# Altium schematic sheet buck__Buck.SchDoc: 12 V to 5 V 3 A Synchronous Buck
size A3; Date: 2026-10-13; Author: Anon Author; DrawnBy: Anon Author; DocumentNumber: buck-12v-5v-3a / Buck; Revision: A; SheetNumber: 1; SheetTotal: 1; ProjectName: buck-12v-5v-3a
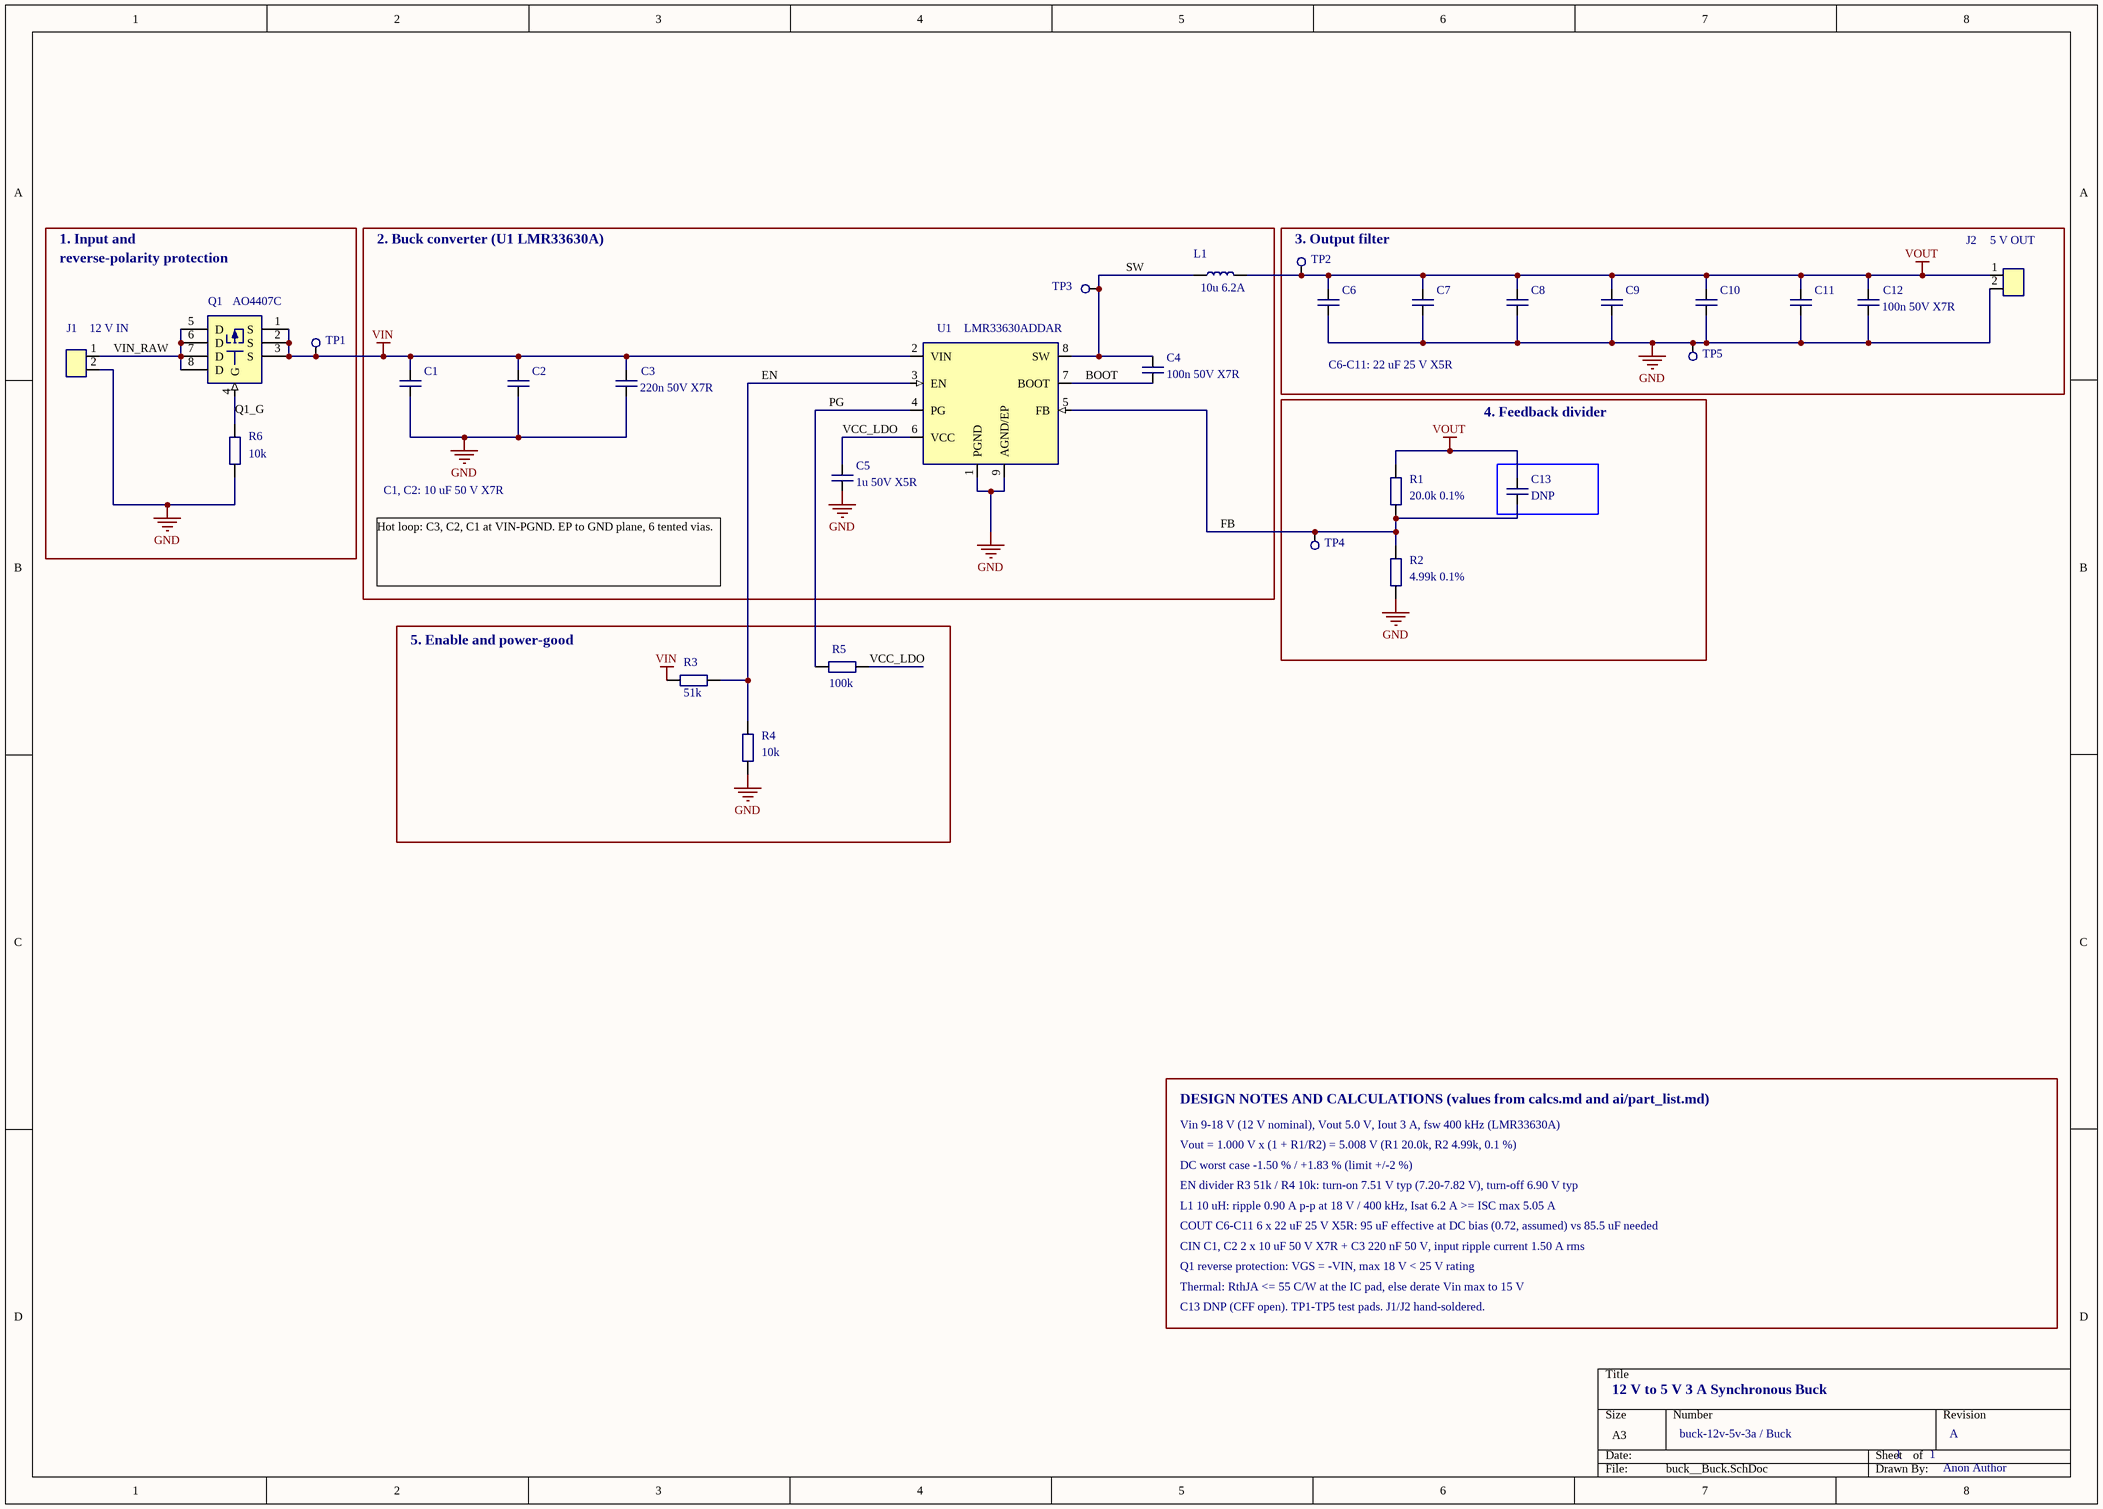
[diagram p0: buck__Buck.SchDoc]

## Parts
C1  10u 50V X7R  [CAPC3216_1206]  (value not drawn)
C2  10u 50V X7R  [CAPC3216_1206]  (value not drawn)
C3  220n 50V X7R  [CAPC1608_0603]
C4  100n 50V X7R  [CAPC1608_0603]
C5  1u 50V X5R  [CAPC1608_0603]
C6  22u 25V X5R  [CAPC3216_1206]  (value not drawn)
C7  22u 25V X5R  [CAPC3216_1206]  (value not drawn)
C8  22u 25V X5R  [CAPC3216_1206]  (value not drawn)
C9  22u 25V X5R  [CAPC3216_1206]  (value not drawn)
C10  22u 25V X5R  [CAPC3216_1206]  (value not drawn)
C11  22u 25V X5R  [CAPC3216_1206]  (value not drawn)
C12  100n 50V X7R  [CAPC1608_0603]
C13  DNP  [CAPC1608_0603]
J1  12 V IN  [TB_MKDS1.5-2-5.08]
J2  5 V OUT  [TB_MKDS1.5-2-5.08]
L1  10u 6.2A  [IND_CDRH10D60]
Q1  AO4407C  [SOIC8_MS012]
R1  20.0k 0.1%  [RESC1608_0603]
R2  4.99k 0.1%  [RESC1608_0603]
R3  51k  [RESC1608_0603]
R4  10k  [RESC1608_0603]
R5  100k  [RESC1608_0603]
R6  10k  [RESC1608_0603]
TP1  TP  [TP_PAD_D1.5]  (value not drawn)
TP2  TP  [TP_PAD_D1.5]  (value not drawn)
TP3  TP  [TP_PAD_D1.5]  (value not drawn)
TP4  TP  [TP_PAD_D1.5]  (value not drawn)
TP5  TP  [TP_PAD_D1.5]  (value not drawn)
U1  LMR33630ADDAR  [LMR33630_HSOIC8_DDA]

## Blocks framed on the sheet
2. Buck converter (U1 LMR33630A): C1-C5 L1 TP3 U1
3. Output filter: C6-C12 J2 TP2 TP5
4. Feedback divider: C13 R1 R2 TP4
5. Enable and power-good: R3-R5

## Nets
GND: C1.2 C2.2 C3.2 C5.2 C6.2 C7.2 C8.2 C9.2 C10.2 C11.2 C12.2 J1.2 J2.2 R2.2 R4.2 R6.2 TP5.1 U1.1(PGND) U1.9(AGND/EP)
VIN: C1.1 C2.1 C3.1 Q1.1(S) Q1.2(S) Q1.3(S) R3.1 TP1.1 U1.2(VIN)
VOUT: C6.1 C7.1 C8.1 C9.1 C10.1 C11.1 C12.1 C13.1 J2.1 L1.2 R1.1 TP2.1
BOOT: C4.2 U1.7(BOOT)
EN: R3.2 R4.1 U1.3(EN)
FB: C13.2 R1.2 R2.1 TP4.1 U1.5(FB)
PG: R5.1 U1.4(PG)
Q1_G: Q1.4(G) R6.1
SW: C4.1 L1.1 TP3.1 U1.8(SW)
VCC_LDO: C5.1 R5.2 U1.6(VCC)
VIN_RAW: J1.1 Q1.5(D) Q1.6(D) Q1.7(D) Q1.8(D)

## Notes on the sheet
- 1. Input and
- reverse-polarity protection
- C6-C11: 22 uF 25 V X5R
- C1, C2: 10 uF 50 V X7R
- Hot loop: C3, C2, C1 at VIN-PGND. EP to GND plane, 6 tented vias.
- DESIGN NOTES AND CALCULATIONS (values from calcs.md and ai/part_list.md)
- Vin 9-18 V (12 V nominal), Vout 5.0 V, Iout 3 A, fsw 400 kHz (LMR33630A)
- Vout = 1.000 V x (1 + R1/R2) = 5.008 V (R1 20.0k, R2 4.99k, 0.1 %)
- DC worst case -1.50 % / +1.83 % (limit +/-2 %)
- EN divider R3 51k / R4 10k: turn-on 7.51 V typ (7.20-7.82 V), turn-off 6.90 V typ
- L1 10 uH: ripple 0.90 A p-p at 18 V / 400 kHz, Isat 6.2 A >= ISC max 5.05 A
- COUT C6-C11 6 x 22 uF 25 V X5R: 95 uF effective at DC bias (0.72, assumed) vs 85.5 uF needed
- CIN C1, C2 2 x 10 uF 50 V X7R + C3 220 nF 50 V, input ripple current 1.50 A rms
- Q1 reverse protection: VGS = -VIN, max 18 V < 25 V rating
- Thermal: RthJA <= 55 C/W at the IC pad, else derate Vin max to 15 V
- C13 DNP (CFF open). TP1-TP5 test pads. J1/J2 hand-soldered.

## Library data of the parts
C1 C2 = C_10u_50V_X7R_1206: CIN: 10 uF 50 V X7R 10% 1206; Manufacturer: FH; MPN: 1206B106K500NT; Value: 10u 50V X7R; LCSC: C303950; JLCPCB Type: Extended; Datasheet: 1206B106K500NT_C303950.pdf
C3 = C_220n_50V_X7R_0603: CHF: 220 nF 50 V X7R 0603; Manufacturer: YAGEO; MPN: CC0603KRX7R9BB224; Value: 220n 50V X7R; LCSC: C107083; JLCPCB Type: Extended; Datasheet: CC0603KRX7R9BB224_C107083.pdf
C4 C12 = C_100n_50V_X7R_0603: CBOOT / HF bypass: 100 nF 50 V X7R 0603; Manufacturer: YAGEO; MPN: CC0603KRX7R9BB104; Value: 100n 50V X7R; LCSC: C14663; JLCPCB Type: Basic; Datasheet: CC0603KRX7R9BB104_C14663.pdf
C5 = C_1u_50V_X5R_0603: CVCC: 1 uF 50 V X5R 0603; Manufacturer: Samsung; MPN: CL10A105KB8NNNC; Value: 1u 50V X5R; LCSC: C15849; JLCPCB Type: Basic; Datasheet: CL10A105KB8NNNC_C15849.pdf
C6-C11 = C_22u_25V_X5R_1206: COUT: 22 uF 25 V X5R 10% 1206; Manufacturer: Samsung; MPN: CL31A226KAHNNNE; Value: 22u 25V X5R; LCSC: C12891; JLCPCB Type: Basic; Datasheet: CL31A226KAHNNNE_C12891.pdf
C13 = C_DNP_0603: CFF footprint only, do not populate (lmr33630 Table 9-2: CFF open); Value: DNP; Manufacturer: -; MPN: -; LCSC: -; JLCPCB Type: -; Datasheet: -
J1 J2 = J_MKDS1.5-2-5.08: Screw terminal 2-pos 5.08 mm, 17.5 A, 250 V; Manufacturer: Phoenix Contact; MPN: 1715721; Value: MKDS 1,5/2-5,08; LCSC: C480516; JLCPCB Type: Extended (hand-soldered, not in SMT order); Datasheet: 1715721_C480516.pdf
L1 = L_10u_CDRH10D60: 10 uH 20%, DCR 17 mOhm +/-30%, Isat 6.2 A, Itemp 6.9 A, shielded, AEC-Q200; Manufacturer: Sumida; MPN: CDRH10D60BT150NP-100MC; Value: 10u 6.2A; LCSC: C2594362; JLCPCB Type: Extended; Datasheet: CDRH10D60BT150NP-100MC_C2594362.pdf
Q1 = Q_AO4407C: P-MOSFET -30 V, VGS +/-25 V, RDS(on) < 11.5 mOhm @ -10 V, < 18.5 mOhm @ -4.5 V, SO-8 (datasheet Preliminary); Manufacturer: Alpha & Omega Semicon; Value: AO4407C; MPN: AO4407C; LCSC: C469397; JLCPCB Type: Extended; Datasheet: AO4407C_C469397.pdf
R1 = R_20k0_0.1%_0603: RFBT: 20.0 kOhm 0.1% 25ppm 100mW 0603 thin film; Manufacturer: RESI; MPN: PTFR0603B20K0P9; Value: 20.0k 0.1%; LCSC: C328424; JLCPCB Type: Extended; Datasheet: PTFR0603B20K0P9_C328424.pdf
R2 = R_4k99_0.1%_0603: RFBB: 4.99 kOhm 0.1% 25ppm 100mW 0603 thin film; Manufacturer: RESI; MPN: PTFR0603B4K99P9; Value: 4.99k 0.1%; LCSC: C5382597; JLCPCB Type: Extended; Datasheet: PTFR0603B4K99P9_C5382597.pdf
R3 = R_51k_1%_0603: RENT: 51 kOhm 1% 100mW 0603; Manufacturer: UNI-ROYAL; MPN: 0603WAF5102T5E; Value: 51k; LCSC: C23196; JLCPCB Type: Basic; Datasheet: 0603WAF5102T5E_C23196.pdf
R4 R6 = R_10k_1%_0603: 10 kOhm 1% 100mW 0603 (RENB, MOSFET gate); Manufacturer: UNI-ROYAL; MPN: 0603WAF1002T5E; Value: 10k; LCSC: C25804; JLCPCB Type: Basic; Datasheet: 0603WAF1002T5E_C25804.pdf
R5 = R_100k_1%_0603: PG pull-up 100 kOhm 1% 0603; Manufacturer: UNI-ROYAL; MPN: 0603WAF1003T5E; Value: 100k; LCSC: C25803; JLCPCB Type: Basic; Datasheet: 0603WAF1003T5E_C25803.pdf
TP1-TP5 = TP_PAD: Test pad 1.5 mm; Value: TP; Manufacturer: -; MPN: -; LCSC: -; JLCPCB Type: - (copper pad, no part); Datasheet: -
U1 = U_LMR33630ADDA: Sync buck 3.8-36 V in, 3 A, 400 kHz (A), HSOIC-8 PowerPAD; EP = AGND; Manufacturer: Texas Instruments; Value: LMR33630ADDAR; MPN: LMR33630ADDAR; LCSC: C841384; JLCPCB Type: Extended; Datasheet: lmr33630.pdf